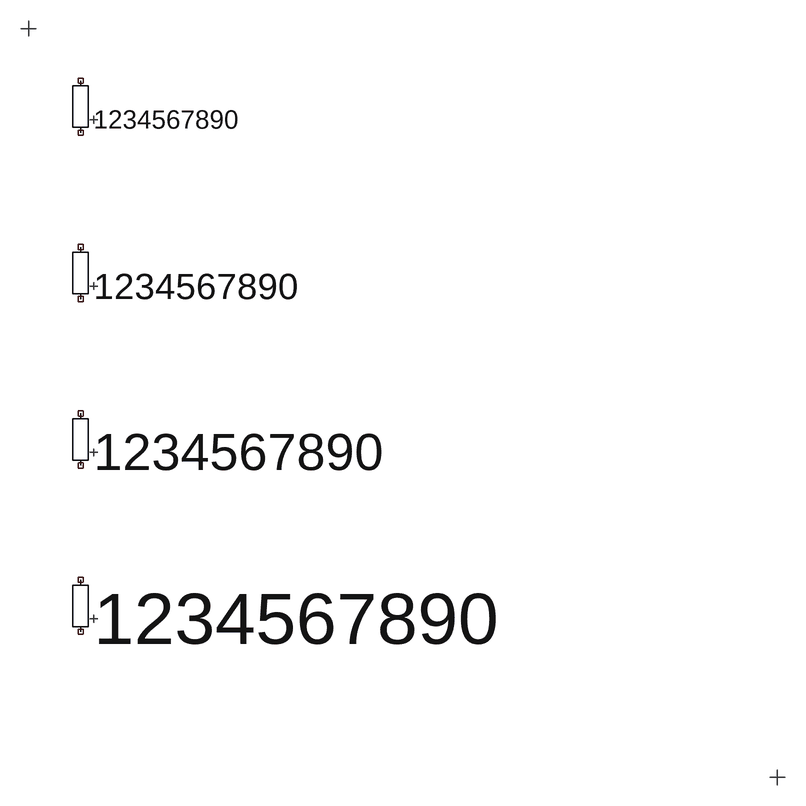
[diagram p0: schematic sizes_4_to_7.asc]
sizes_4_to_7.asc, the LTspice schematic file:
Version 4
SHEET 1 2400 1600
WIRE -76 -64 -52 -64
WIRE -64 -76 -64 -52
WIRE 1076 1088 1100 1088
WIRE 1088 1076 1088 1100
WIRE 30 76 42 76
WIRE 36 70 36 82
SYMBOL res 0 0 R0
WINDOW 0 0 0 Invisible 2
WINDOW 3 36 76 Left 4
SYMATTR InstName R1
SYMATTR Value 1234567890
WIRE 30 332 42 332
WIRE 36 326 36 338
SYMBOL res 0 256 R0
WINDOW 0 0 0 Invisible 2
WINDOW 3 36 76 Left 5
SYMATTR InstName R2
SYMATTR Value 1234567890
WIRE 30 588 42 588
WIRE 36 582 36 594
SYMBOL res 0 512 R0
WINDOW 0 0 0 Invisible 2
WINDOW 3 36 76 Left 6
SYMATTR InstName R3
SYMATTR Value 1234567890
WIRE 30 844 42 844
WIRE 36 838 36 850
SYMBOL res 0 768 R0
WINDOW 0 0 0 Invisible 2
WINDOW 3 36 76 Left 7
SYMATTR InstName R4
SYMATTR Value 1234567890

The netlist it stands for:
* sizes_4_to_7.asc
R1 NC_01 NC_02 1234567890
R2 NC_03 NC_04 1234567890
R3 NC_05 NC_06 1234567890
R4 NC_07 NC_08 1234567890
.backanno
.end